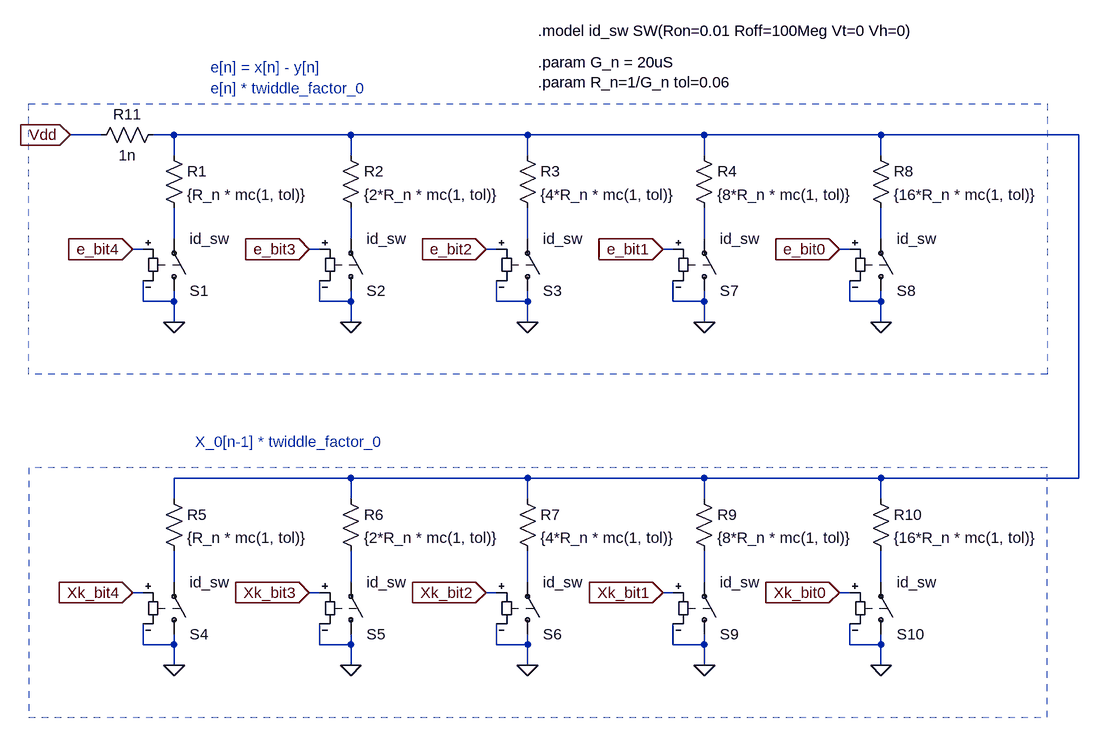
[diagram p0: schematic branch_k.asc]
branch_k.asc, the LTspice schematic file:
Version 4.1
SHEET 1 1796 1140
WIRE -320 -224 -368 -224
WIRE -208 -224 -240 -224
WIRE 64 -224 -208 -224
WIRE 336 -224 64 -224
WIRE 608 -224 336 -224
WIRE 880 -224 608 -224
WIRE 1184 -224 880 -224
WIRE -208 -192 -208 -224
WIRE 64 -192 64 -224
WIRE 336 -192 336 -224
WIRE 608 -192 608 -224
WIRE 880 -192 880 -224
WIRE -208 -64 -208 -112
WIRE 64 -64 64 -112
WIRE 336 -64 336 -112
WIRE 608 -64 608 -112
WIRE 880 -64 880 -112
WIRE -256 -48 -272 -48
WIRE 16 -48 0 -48
WIRE 288 -48 272 -48
WIRE 560 -48 544 -48
WIRE 832 -48 816 -48
WIRE -256 32 -256 0
WIRE -208 32 -208 16
WIRE -208 32 -256 32
WIRE 16 32 16 0
WIRE 64 32 64 16
WIRE 64 32 16 32
WIRE 288 32 288 0
WIRE 336 32 336 16
WIRE 336 32 288 32
WIRE 560 32 560 0
WIRE 608 32 608 16
WIRE 608 32 560 32
WIRE 832 32 832 0
WIRE 880 32 880 16
WIRE 880 32 832 32
WIRE -208 64 -208 32
WIRE 64 64 64 32
WIRE 336 64 336 32
WIRE 608 64 608 32
WIRE 880 64 880 32
WIRE 64 304 -208 304
WIRE 336 304 64 304
WIRE 608 304 336 304
WIRE 880 304 608 304
WIRE 1184 304 1184 -224
WIRE 1184 304 880 304
WIRE -208 336 -208 304
WIRE 64 336 64 304
WIRE 336 336 336 304
WIRE 608 336 608 304
WIRE 880 336 880 304
WIRE -208 464 -208 416
WIRE 64 464 64 416
WIRE 336 464 336 416
WIRE 608 464 608 416
WIRE 880 464 880 416
WIRE -256 480 -272 480
WIRE 16 480 0 480
WIRE 288 480 272 480
WIRE 560 480 544 480
WIRE 832 480 816 480
WIRE -256 560 -256 528
WIRE -208 560 -208 544
WIRE -208 560 -256 560
WIRE 16 560 16 528
WIRE 64 560 64 544
WIRE 64 560 16 560
WIRE 288 560 288 528
WIRE 336 560 336 544
WIRE 336 560 288 560
WIRE 560 560 560 528
WIRE 608 560 608 544
WIRE 608 560 560 560
WIRE 832 560 832 528
WIRE 880 560 880 544
WIRE 880 560 832 560
WIRE -208 592 -208 560
WIRE 64 592 64 560
WIRE 336 592 336 560
WIRE 608 592 608 560
WIRE 880 592 880 560
FLAG -208 64 0
FLAG 64 64 0
FLAG 336 64 0
FLAG -208 592 0
FLAG 64 592 0
FLAG 336 592 0
FLAG 608 64 0
FLAG 880 64 0
FLAG 608 592 0
FLAG 880 592 0
FLAG -368 -224 Vdd
IOPIN -368 -224 In
FLAG -272 -48 e_bit4
IOPIN -272 -48 In
FLAG 0 -48 e_bit3
IOPIN 0 -48 In
FLAG 272 -48 e_bit2
IOPIN 272 -48 In
FLAG 544 -48 e_bit1
IOPIN 544 -48 In
FLAG 816 -48 e_bit0
IOPIN 816 -48 In
FLAG -272 480 Xk_bit4
IOPIN -272 480 In
FLAG 0 480 Xk_bit3
IOPIN 0 480 In
FLAG 272 480 Xk_bit2
IOPIN 272 480 In
FLAG 544 480 Xk_bit1
IOPIN 544 480 In
FLAG 816 480 Xk_bit0
IOPIN 816 480 In
SYMBOL res -224 -208 R0
SYMATTR InstName R1
SYMATTR Value {R_n * mc(1, tol)}
SYMBOL res 48 -208 R0
SYMATTR InstName R2
SYMATTR Value {2*R_n * mc(1, tol)}
SYMBOL res 320 -208 R0
SYMATTR InstName R3
SYMATTR Value {4*R_n * mc(1, tol)}
SYMBOL sw -208 32 M180
SYMATTR InstName S1
SYMATTR Value id_sw
SYMBOL sw 64 32 M180
SYMATTR InstName S2
SYMATTR Value id_sw
SYMBOL sw 336 32 M180
SYMATTR InstName S3
SYMATTR Value id_sw
SYMBOL res -224 -240 R90
WINDOW 0 0 56 VBottom 2
WINDOW 3 32 56 VTop 2
SYMATTR InstName R11
SYMATTR Value 1n
SYMBOL sw -208 560 M180
SYMATTR InstName S4
SYMATTR Value id_sw
SYMBOL sw 64 560 M180
SYMATTR InstName S5
SYMATTR Value id_sw
SYMBOL sw 336 560 M180
SYMATTR InstName S6
SYMATTR Value id_sw
SYMBOL res -224 320 R0
SYMATTR InstName R5
SYMATTR Value {R_n * mc(1, tol)}
SYMBOL res 48 320 R0
SYMATTR InstName R6
SYMATTR Value {2*R_n * mc(1, tol)}
SYMBOL res 320 320 R0
SYMATTR InstName R7
SYMATTR Value {4*R_n * mc(1, tol)}
SYMBOL res 592 -208 R0
SYMATTR InstName R4
SYMATTR Value {8*R_n * mc(1, tol)}
SYMBOL sw 608 32 M180
SYMATTR InstName S7
SYMATTR Value id_sw
SYMBOL res 864 -208 R0
SYMATTR InstName R8
SYMATTR Value {16*R_n * mc(1, tol)}
SYMBOL sw 880 32 M180
SYMATTR InstName S8
SYMATTR Value id_sw
SYMBOL sw 608 560 M180
SYMATTR InstName S9
SYMATTR Value id_sw
SYMBOL res 592 320 R0
SYMATTR InstName R9
SYMATTR Value {8*R_n * mc(1, tol)}
SYMBOL sw 880 560 M180
SYMATTR InstName S10
SYMATTR Value id_sw
SYMBOL res 864 320 R0
SYMATTR InstName R10
SYMATTR Value {16*R_n * mc(1, tol)}
TEXT 352 -384 Left 2 !.model id_sw SW(Ron=0.01 Roff=100Meg Vt=0 Vh=0)
TEXT 352 -336 Left 2 !.param G_n = 20uS\n.param R_n=1/G_n tol=0.06
TEXT -152 -328 Left 2 ;e[n] = x[n] - y[n]
TEXT -152 -296 Left 2 ;e[n] * twiddle_factor_0
TEXT -176 248 Left 2 ;X_0[n-1] * twiddle_factor_0
RECTANGLE Normal 1136 144 -432 -272 2
RECTANGLE Normal -432 672 1136 288 2

The netlist it stands for:
* branch_k.asc
R1 N001 N002 {R_n * mc(1, tol)}
R2 N001 N003 {2*R_n * mc(1, tol)}
R3 N001 N004 {4*R_n * mc(1, tol)}
S1 0 N002 e_bit4 0 id_sw
S2 0 N003 e_bit3 0 id_sw
S3 0 N004 e_bit2 0 id_sw
R11 N001 Vdd 1n
S4 0 N007 Xk_bit4 0 id_sw
S5 0 N008 Xk_bit3 0 id_sw
S6 0 N009 Xk_bit2 0 id_sw
R5 N001 N007 {R_n * mc(1, tol)}
R6 N001 N008 {2*R_n * mc(1, tol)}
R7 N001 N009 {4*R_n * mc(1, tol)}
R4 N001 N005 {8*R_n * mc(1, tol)}
S7 0 N005 e_bit1 0 id_sw
R8 N001 N006 {16*R_n * mc(1, tol)}
S8 0 N006 e_bit0 0 id_sw
S9 0 N010 Xk_bit1 0 id_sw
R9 N001 N010 {8*R_n * mc(1, tol)}
S10 0 N011 Xk_bit0 0 id_sw
R10 N001 N011 {16*R_n * mc(1, tol)}
.model id_sw SW(Ron=0.01 Roff=100Meg Vt=0 Vh=0)
.param G_n = 20uS
.param R_n=1/G_n tol=0.06
* e[n] = x[n] - y[n]
* e[n] * twiddle_factor_0
* X_0[n-1] * twiddle_factor_0
.backanno
.end